# EAGLE schematic AutoBath-Light-Fan_schematic (EAGLE 9.6.2)
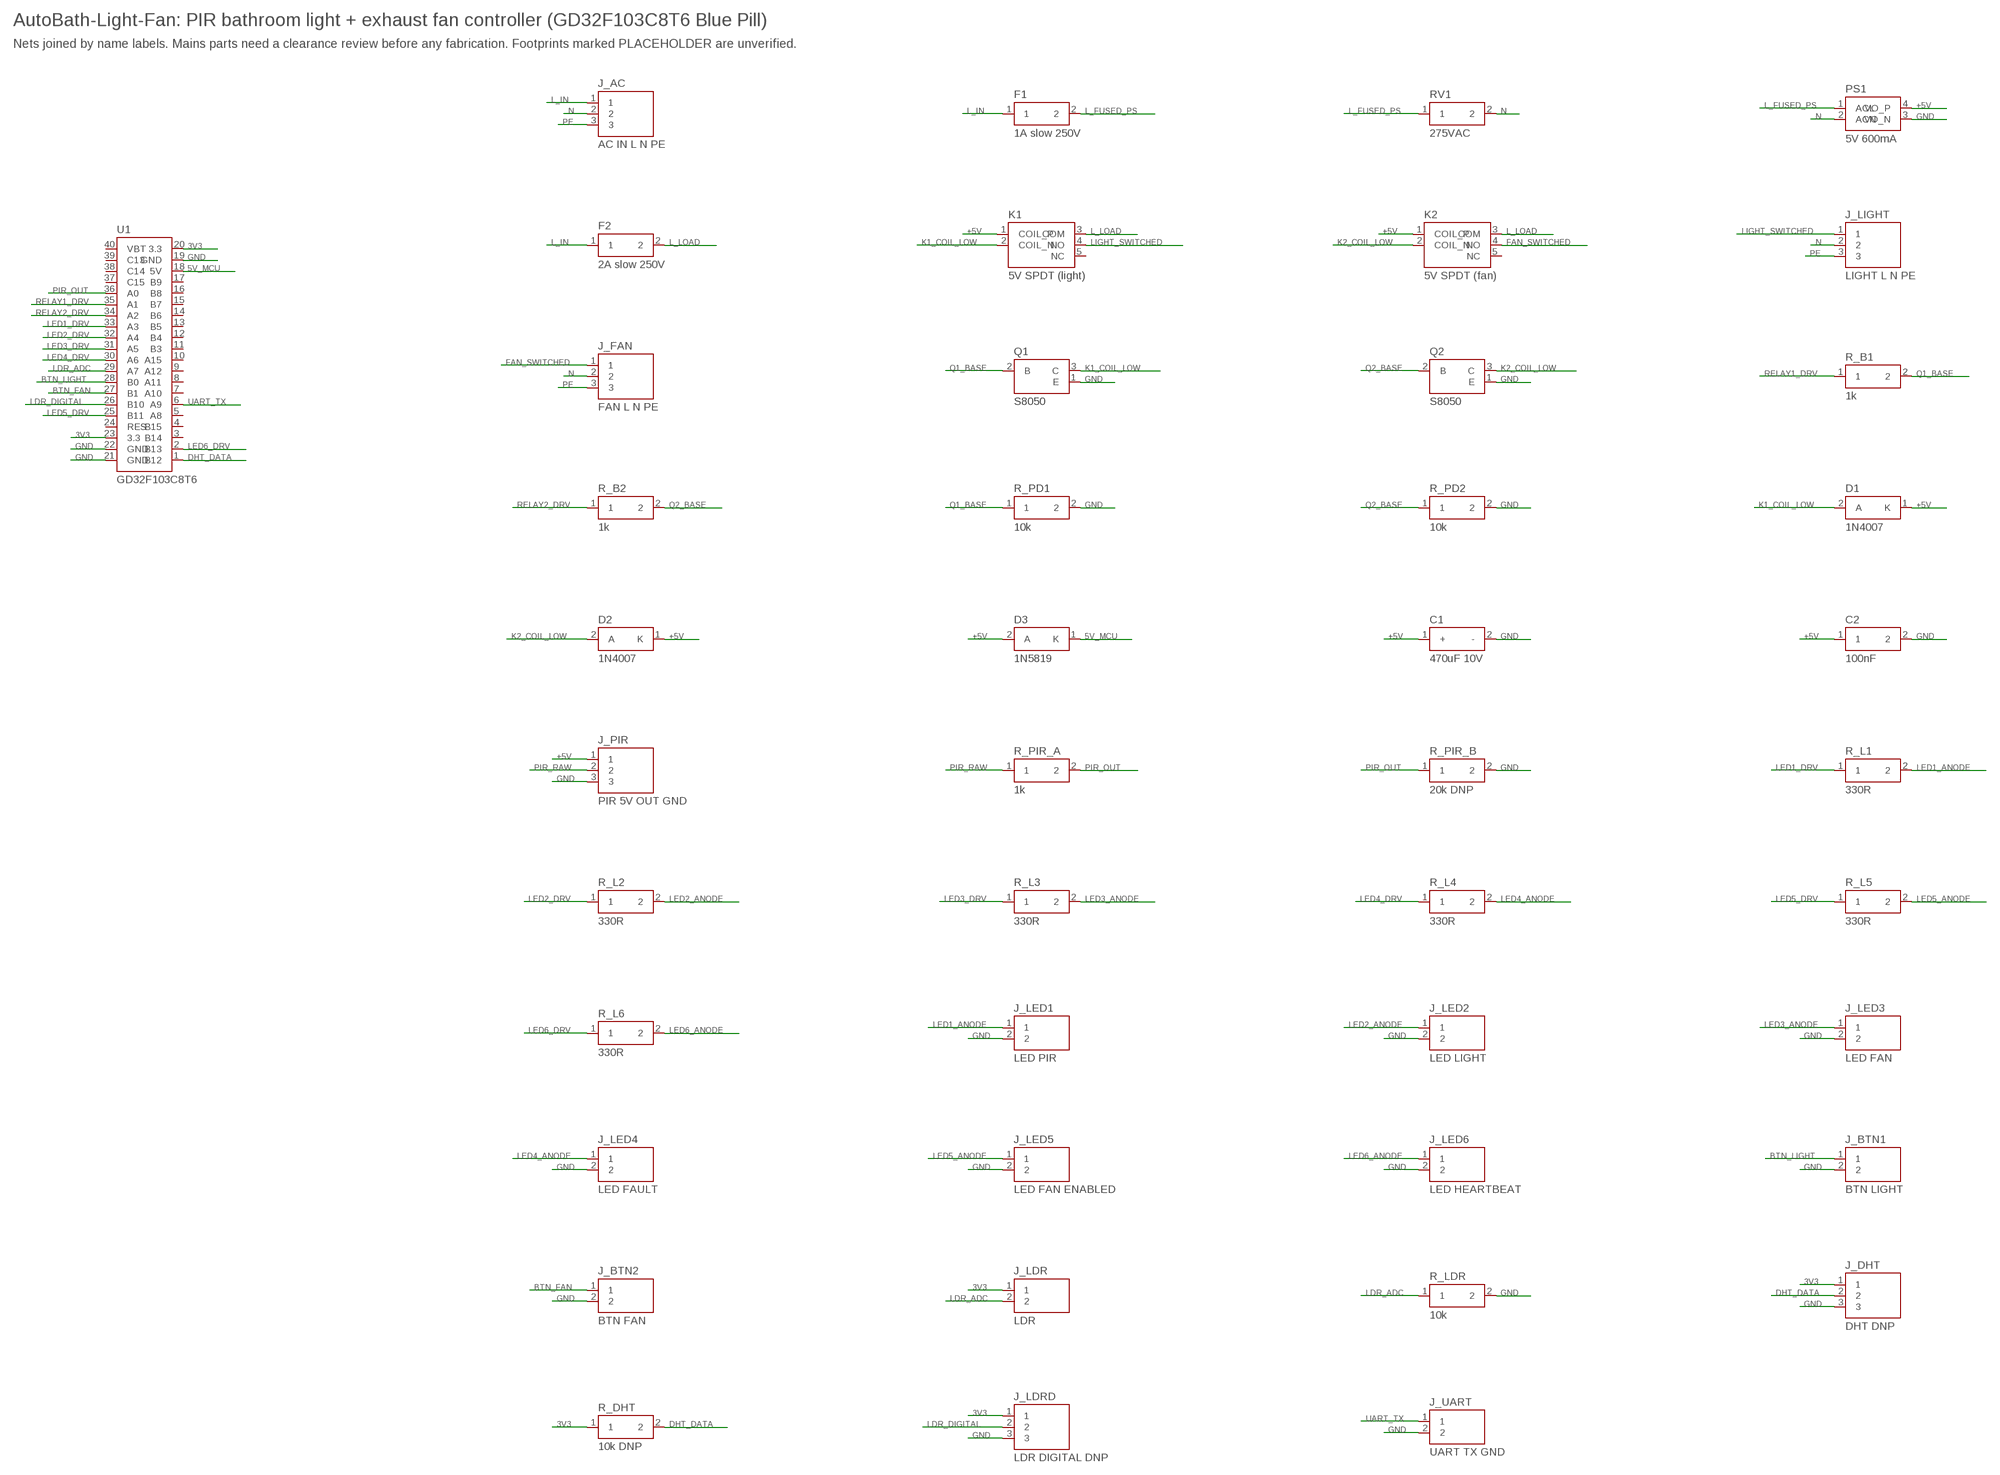
[diagram p0: schematic, sheet 1]

## Parts
C1  470uF 10V  CAP  [RADIAL_2.5]
C2  100nF  CAP_CER  [DISC_5.0]
D1  1N4007  DIODE  [DO41_10.16]
D2  1N4007  DIODE  [DO41_10.16]
D3  1N5819  DIODE  [DO41_10.16]
F1  1A slow 250V  FUSE  [FUSE_5X20_22.5]
F2  2A slow 250V  FUSE  [FUSE_5X20_22.5]
J_AC  AC IN L N PE  TERM3  [TERM_3P_5.08]
J_BTN1  BTN LIGHT  HDR2  [HDR_1X2]
J_BTN2  BTN FAN  HDR2  [HDR_1X2]
J_DHT  DHT DNP  HDR3  [HDR_1X3]
J_FAN  FAN L N PE  TERM3  [TERM_3P_5.08]
J_LDR  LDR  HDR2  [HDR_1X2]
J_LDRD  LDR DIGITAL DNP  HDR3  [HDR_1X3]
J_LED1  LED PIR  HDR2  [HDR_1X2]
J_LED2  LED LIGHT  HDR2  [HDR_1X2]
J_LED3  LED FAN  HDR2  [HDR_1X2]
J_LED4  LED FAULT  HDR2  [HDR_1X2]
J_LED5  LED FAN ENABLED  HDR2  [HDR_1X2]
J_LED6  LED HEARTBEAT  HDR2  [HDR_1X2]
J_LIGHT  LIGHT L N PE  TERM3  [TERM_3P_5.08]
J_PIR  PIR 5V OUT GND  HDR3  [HDR_1X3]
J_UART  UART TX GND  HDR2  [HDR_1X2]
K1  5V SPDT (light)  RELAY  [RELAY_SRD_5PIN]
K2  5V SPDT (fan)  RELAY  [RELAY_SRD_5PIN]
PS1  5V 600mA  ACDC5V  [ACDC_4PIN]
Q1  S8050  NPN  [TO92_2.54]
Q2  S8050  NPN  [TO92_2.54]
R_B1  1k  RES  [AXIAL_10.16]
R_B2  1k  RES  [AXIAL_10.16]
R_DHT  10k DNP  RES  [AXIAL_10.16]
R_L1  330R  RES  [AXIAL_10.16]
R_L2  330R  RES  [AXIAL_10.16]
R_L3  330R  RES  [AXIAL_10.16]
R_L4  330R  RES  [AXIAL_10.16]
R_L5  330R  RES  [AXIAL_10.16]
R_L6  330R  RES  [AXIAL_10.16]
R_LDR  10k  RES  [AXIAL_10.16]
R_PD1  10k  RES  [AXIAL_10.16]
R_PD2  10k  RES  [AXIAL_10.16]
R_PIR_A  1k  RES  [AXIAL_10.16]
R_PIR_B  20k DNP  RES  [AXIAL_10.16]
RV1  275VAC  VARISTOR  [VARISTOR_7.5]
U1  GD32F103C8T6  BLUEPILL_GD32F103C8T6  [BLUEPILL_40P]

## Nets
3V3: J_DHT.1 J_LDR.1 J_LDRD.1 R_DHT.1 U1.20(3.3) U1.23(3.3​)
5V_MCU: D3.1(K) U1.18(5V)
+5V: C1.1(+) C2.1 D1.1(K) D2.1(K) D3.2(A) J_PIR.1 K1.1(COIL_P) K2.1(COIL_P) PS1.4(VO_P)
BTN_FAN: J_BTN2.1 U1.27(B1)
BTN_LIGHT: J_BTN1.1 U1.28(B0)
DHT_DATA: J_DHT.2 R_DHT.2 U1.1(B12)
FAN_SWITCHED: J_FAN.1 K2.4(NO)
GND: C1.2(-) C2.2 J_BTN1.2 J_BTN2.2 J_DHT.3 J_LDRD.3 J_LED1.2 J_LED2.2 J_LED3.2 J_LED4.2 J_LED5.2 J_LED6.2 J_PIR.3 J_UART.2 PS1.3(VO_N) Q1.1(E) Q2.1(E) R_LDR.2 R_PD1.2 R_PD2.2 R_PIR_B.2 U1.19(GND) U1.21(GND​) U1.22(GND​​)
K1_COIL_LOW: D1.2(A) K1.2(COIL_N) Q1.3(C)
K2_COIL_LOW: D2.2(A) K2.2(COIL_N) Q2.3(C)
L_FUSED_PS: F1.2 PS1.1(ACL) RV1.1
L_IN: F1.1 F2.1 J_AC.1
L_LOAD: F2.2 K1.3(COM) K2.3(COM)
LDR_ADC: J_LDR.2 R_LDR.1 U1.29(A7)
LDR_DIGITAL: J_LDRD.2 U1.26(B10)
LED1_ANODE: J_LED1.1 R_L1.2
LED1_DRV: R_L1.1 U1.33(A3)
LED2_ANODE: J_LED2.1 R_L2.2
LED2_DRV: R_L2.1 U1.32(A4)
LED3_ANODE: J_LED3.1 R_L3.2
LED3_DRV: R_L3.1 U1.31(A5)
LED4_ANODE: J_LED4.1 R_L4.2
LED4_DRV: R_L4.1 U1.30(A6)
LED5_ANODE: J_LED5.1 R_L5.2
LED5_DRV: R_L5.1 U1.25(B11)
LED6_ANODE: J_LED6.1 R_L6.2
LED6_DRV: R_L6.1 U1.2(B13)
LIGHT_SWITCHED: J_LIGHT.1 K1.4(NO)
N: J_AC.2 J_FAN.2 J_LIGHT.2 PS1.2(ACN) RV1.2
PE: J_AC.3 J_FAN.3 J_LIGHT.3
PIR_OUT: R_PIR_A.2 R_PIR_B.1 U1.36(A0)
PIR_RAW: J_PIR.2 R_PIR_A.1
Q1_BASE: Q1.2(B) R_B1.2 R_PD1.1
Q2_BASE: Q2.2(B) R_B2.2 R_PD2.1
RELAY1_DRV: R_B1.1 U1.35(A1)
RELAY2_DRV: R_B2.1 U1.34(A2)
UART_TX: J_UART.1 U1.6(A9)
Unconnected: K1.5(NC) K2.5(NC) U1.3(B14) U1.4(B15) U1.5(A8) U1.7(A10) U1.8(A11) U1.9(A12) U1.10(A15) U1.11(B3) U1.12(B4) U1.13(B5) U1.14(B6) U1.15(B7) U1.16(B8) U1.17(B9) U1.24(RES) U1.37(C15) U1.38(C14) U1.39(C13) U1.40(VBT)

## Notes on the sheet
- AutoBath-Light-Fan: PIR bathroom light + exhaust fan controller (GD32F103C8T6 Blue Pill)
- Nets joined by name labels. Mains parts need a clearance review before any fabrication. Footprints marked PLACEHOLDER are unverified.

## Library data of the parts
C1 = AutoBath:CAP: Electrolytic capacitor
C2 = AutoBath:CAP_CER: Ceramic capacitor
D1-D3 = AutoBath:DIODE: Diode (K = banded end)
F1 F2 = AutoBath:FUSE: Fuse in a holder
J_AC J_FAN J_LIGHT = AutoBath:TERM3: 3-pole screw terminal
J_BTN1 J_BTN2 J_LDR J_LED1-J_LED6 J_UART = AutoBath:HDR2: 2-pin header
J_DHT J_LDRD J_PIR = AutoBath:HDR3: 3-pin header
K1 K2 = AutoBath:RELAY: SPDT relay 5 V coil, use COM and NO
PS1 = AutoBath:ACDC5V: AC-DC 5V 3W module (HLK-PM01 style)
Q1 Q2 = AutoBath:NPN: NPN transistor TO-92
R_B1 R_B2 R_DHT R_L1-R_L6 R_LDR R_PD1 R_PD2 R_PIR_A R_PIR_B = AutoBath:RES: Resistor
RV1 = AutoBath:VARISTOR: Varistor
U1 = AutoBath:BLUEPILL_GD32F103C8T6: Blue Pill GD32F103C8T6 module (pin names carry this project's pin roles)